# Altium schematic sheet Sheet1.SchDoc
size A; SheetNumber: 1; SheetTotal: 1
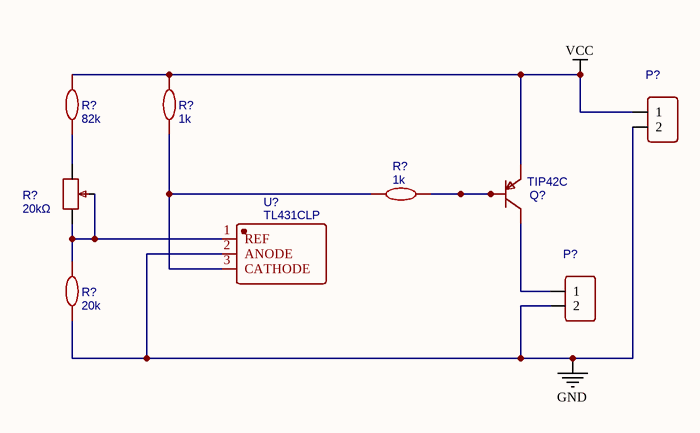
[diagram p0: Sheet1.SchDoc]

## Parts
(Parts that share a designator on the sheet are numbered #1, #2 ... from top to bottom, then left to right.)
P?#1  CONN-TH_2P-P5.00  [CONN-TH_2P-P5.00]  (value not drawn)
P?#2  CONN-TH_2P-P5.00  [CONN-TH_2P-P5.00]  (value not drawn)
Q?  TIP42C  [TO-220-3_L10.0-W4.5-P2.54-T]
R?#1  82k  [AXIAL-0.3]
R?#2  1k  [AXIAL-0.3]
R?#3  20kΩ  [RES-ADJ-TH_3296W]
R?#4  1k  [AXIAL-0.3]
R?#5  20k  [AXIAL-0.3]
U?  TL431CLP  [TO-92-3_L4.9-W3.7-P1.27-L]

## Nets
GND: P?#1.2 P?#2.2 R?#5.2 U?.2(ANODE)
VCC: P?#1.1 Q?.3(E) R?#1.1 R?#2.1
NetP?#2_1: P?#2.1 Q?.2(C)
NetQ?_1: Q?.1(B) R?#4.1
NetR?#1_2: R?#1.2 R?#3.3
NetR?#2_2: R?#2.2 R?#4.2 U?.3(CATHODE)
NetR?#3_1: R?#3.1 R?#3.2 R?#5.1 U?.1(REF)

## Library data of the parts
P?#1 P?#2 = CONN-TH_2P-P5.00: Contributor: LCEDA_Lib; Supplier: LCSC; spicePre: P; spiceSymbolName: CONN-TH_2P-P5.00
Q? = TIP42C: Manufacturer: CJ; Supplier: LCSC; Manufacturer Part: TIP42C; Supplier Part: C92311; JLCPCB Part Class: Extended Part; spicePre: Q; spiceSymbolName: TIP42C
R?#1 = 82k: nameAlias: Value(Ω); Manufacturer Part: ?; spicePre: R; spiceSymbolName: Resistor
R?#2 R?#4 = 1k: nameAlias: Value(Ω); Manufacturer Part: ?; spicePre: R; spiceSymbolName: Resistor
R?#3 = 20kΩ: Manufacturer: Chengdu Guosheng Tech; Manufacturer Part: 3296W-1-504; Resistance(Ohms): 500K; nameAlias: Resistance; Contributor: LCSC; Supplier: LCSC; Supplier Part: C330437; Resistance (Ohms): 500K; JLCPCB Part Class: Extended Part; spicePre: R; spiceSymbolName: 3296W-1-504_C330437
R?#5 = 20k: nameAlias: Value(Ω); Manufacturer Part: ?; spicePre: R; spiceSymbolName: Resistor
U? = TL431CLP: Manufacturer: Texas Instruments; Contributor: LCSC; Supplier: LCSC; Supplier Part: C398376; Manufacturer Part: TL431CLP; JLCPCB Part Class: Extended Part; spicePre: U; spiceSymbolName: TL431CLP